# EAGLE design ring_oled_v3-touch (EAGLE 9.6.2)
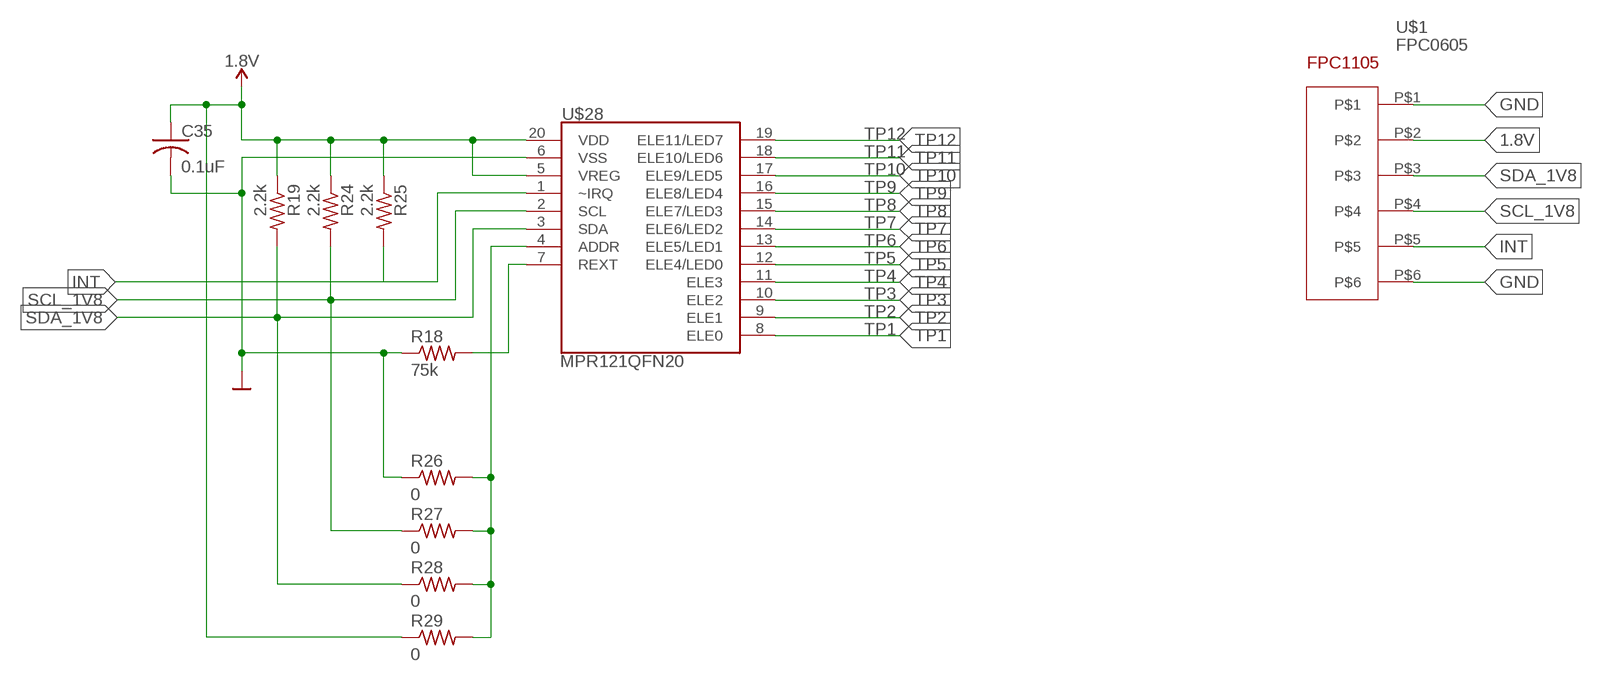
[diagram p0: schematic, sheet 1]

## Parts
C35  0.1uF  C-USC0402  [C0402]
R18  75k  R-US_R0402  [R0402]
R19  2.2k  R-US_R0402  [R0402]
R24  2.2k  R-US_R0402  [R0402]
R25  2.2k  R-US_R0402  [R0402]
R26  0  R-US_R0402  [R0402]
R27  0  R-US_R0402  [R0402]
R28  0  R-US_R0402  [R0402]
R29  0  R-US_R0402  [R0402]
U$1  FPC0605  [FPC0605]
U$28  MPR121QFN20  [QFN-20-0.4MM]

## Nets
1.8V [power]: C35.1 R19.1 R24.1 R25.1 R29.1 U$1.P$2 U$28.5(VREG) U$28.20(VDD)
GND: C35.2 R18.1 R26.1 U$1.P$1 U$1.P$6 U$28.6(VSS)
INT: R25.2 U$1.P$5 U$28.1(~IRQ)
N$15: R18.2 U$28.7(REXT)
N$21: R26.2 R27.2 R28.2 R29.2 U$28.4(ADDR)
SCL_1V8: R24.2 R27.1 U$1.P$4 U$28.2(SCL)
SDA_1V8: R19.2 R28.1 U$1.P$3 U$28.3(SDA)
TP1: U$28.8(ELE0)
TP2: U$28.9(ELE1)
TP3: U$28.10(ELE2)
TP4: U$28.11(ELE3)
TP5: U$28.12(ELE4/LED0)
TP6: U$28.13(ELE5/LED1)
TP7: U$28.14(ELE6/LED2)
TP8: U$28.15(ELE7/LED3)
TP9: U$28.16(ELE8/LED4)
TP10: U$28.17(ELE9/LED5)
TP11: U$28.18(ELE10/LED6)
TP12: U$28.19(ELE11/LED7)

## Library data of the parts
C35 = rcl:C-US: CAPACITOR, American symbol; SPICEPREFIX: C
R18 R19 R24-R29 = rcl:R-US_: RESISTOR, American symbol; SPICEPREFIX: R
U$1 = fpc_card_edge:FPC0605
U$28 = MPR121:MPR121: MPR121 Capacitive Touch Sensor Controller Check availability <https://pricing.snapeda.com/parts/MPR121/Freescale%20Semiconductor%20-%20NXP/view-part?ref=eda>; AVAILABILITY: In Stock; CHECK_PRICES: https://www.snapeda.com/parts/MPR121/NXP+Semiconductors/view-part/?ref=eda; DESCRIPTION: Proximity Capacitive Touch Sensor Controller; MF: Freescale Semiconductor - NXP; MP: MPR121; PACKAGE: None; PRICE: None; SNAPEDA_LINK: https://www.snapeda.com/parts/MPR121/NXP+Semiconductors/view-part/?ref=snap

## Net classes
1 power: width 0.203 mm

## Board
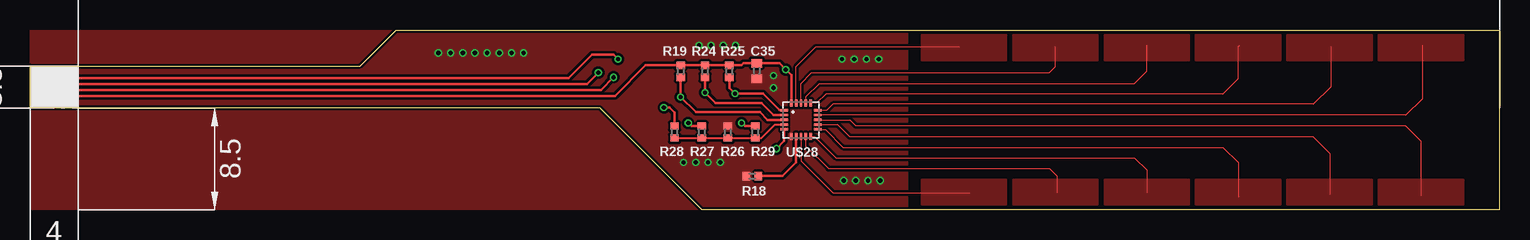
[diagram p1: board, top side]
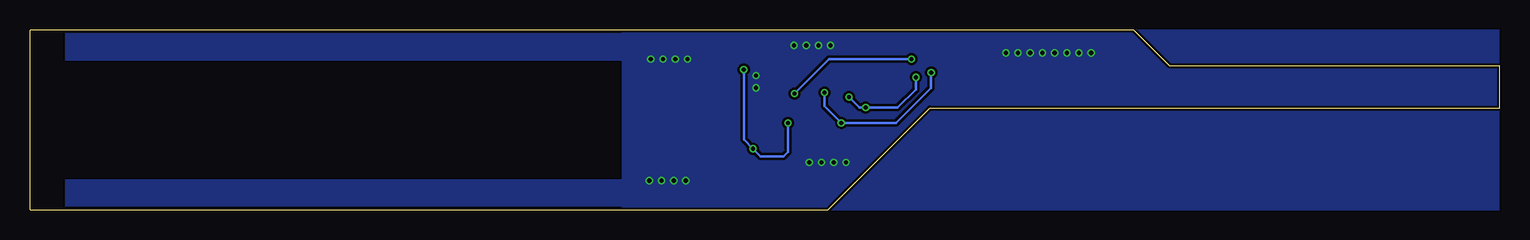
[diagram p2: board, bottom side, seen from below]

Size 122.5 x 15 mm. Coordinates in mm from the lower left corner, seen from the top.
Outline: 122.5,0 122.5,15 30.5,15 27.5,12 0,12 0,8.5 47.5,8.5 56,0 122.5,0
Copper layers (1*16): Top 0.035mm / dielectric 1.6mm / Bottom 0.035mm
Design rules "jlcpcb-2layers *": minimum track width 4mil, minimum drill 0.3mm, track to track 5mil, track to pad 5mil, pad to pad 5mil, via to via 5mil, smd to smd 5mil, copper to edge 0.2mm, drill to drill 6mil, minimum pad ring 10mil, minimum via ring 3mil, stop-mask expansion 4mil, vias tented up to drill 20mil, thermal gap 10mil

### Footprints (pad centres in the part's own frame; a part is rotated, then mirrored left to right if it is on the bottom)
C0402 = smd 0.7 x 0.9: 1 -0.65,0; 2 0.65,0
R0402 = smd 0.6 x 0.7: 1 -0.5,0; 2 0.5,0
FPC0605 = smd 0.3 x 3.5: P$1 1.25,0; P$2 0.75,0; P$3 0.25,0; P$4 -0.25,0; P$5 -0.75,0; P$6 -1.25,0
QFN-20-0.4MM = smd 0.6 x 0.2: 1 -1.4,0.8; 2 -1.4,0.4; 3 -1.4,0; 4 -1.4,-0.4; 5 -1.4,-0.8; 11 1.4,-0.8; 12 1.4,-0.4; 13 1.4,0; 14 1.4,0.4; 15 1.4,0.8 | smd 0.2 x 0.6: 6 -0.8,-1.4; 7 -0.4,-1.4; 8 0,-1.4; 9 0.4,-1.4; 10 0.8,-1.4; 16 0.8,1.4; 17 0.4,1.4; 18 0,1.4; 19 -0.4,1.4; 20 -0.8,1.4

### Placement (x,y rotation side)
C35  60.59,11.57 270 top
R18  60.21,2.79 0 top
R19  54.24,11.55 270 top
R24  56.27,11.55 270 top
R25  58.3,11.55 270 top
R26  58.17,6.47 270 top
R27  56.01,6.47 270 top
R28  53.73,6.47 270 top
R29  60.46,6.47 270 top
U$1  1.75,10.25 270 top
U$28  64.27,7.49 0 top

### Tracks (layer width: path | path; a pad name or v marks a point on that pad's centre or on a via)
1.8V  (via drill 0.35 pad 0.6)
  Top 0.203: U$28.20 63.47,11.21 v63,11.68 62.46,12.22 C35.1 59.49,12.22 59.32,12.05 R25.1 R24.1 R19.1 54.22,12.06 51.31,12.06 48.75,9.5 U$1.P$2 | U$28.5 62.87,5.71 v62.24,5.08 | R29.1 59.59,6.97 v59.32,7.24
  Bottom 0.203: v63,11.68 63,5.84 v62.24,5.08 61.6,4.45 59.7,4.45 59.32,4.83 v59.32,7.24
GND  (via drill 0.35 pad 0.6)
  other vias: 34.04,13.08 35.06,13.08 36.08,13.08 37.09,13.08 55.76,13.72 56.78,13.72 57.79,13.72 58.81,13.72 54.49,3.94 55.51,3.94 56.52,3.94 57.54,3.94 38.11,13.08 39.12,13.08 40.14,13.08 41.16,13.08 61.98,11.18 61.98,10.16 67.7,12.57 68.71,12.57 69.73,12.57 70.75,12.57 67.83,2.41 68.84,2.41 69.86,2.41 70.87,2.41
  pour Top (isolate 0.203, no thermals): 73.16,0 0.01,0 0.01,14.99 73.16,14.99
  pour Bottom (isolate 0.203, no thermals): 73.16,0 0.01,0 0.01,14.99 73.16,14.99
  pour Bottom (no thermals): 73.16,14.73 73.16,12.45 119.51,12.45 119.51,14.61 119.51,14.73
  pour Bottom (no thermals): 73.16,2.54 73.16,0.25 119.51,0.25 119.51,2.41 119.51,2.54
INT  (via drill 0.35 pad 0.6)
  Top 0.203: U$1.P$5 44.92,11 46.87,12.95 48.65,12.95 v49.03,12.57 | R25.2 58.3,10.16 v58.77,9.69 61.09,9.69 62.49,8.29 U$28.1
  Bottom 0.203: v49.03,12.57 55.89,12.57 v58.77,9.69
N$15
  Top 0.203: R18.2 62.74,2.79 63.87,3.92 U$28.7
N$21
  Top 0.178: R28.2 R27.2 R26.2 R29.2 60.97,5.97 62.09,7.09 U$28.4
SCL_1V8  (via drill 0.35 pad 0.6)
  Top 0.203: R24.2 v56.27,9.78 57.16,8.89 60.97,8.89 61.96,7.89 U$28.2 | R27.1 55.14,6.97 v54.87,7.24 | U$1.P$4 46.45,10.5 v47.38,11.43
  Bottom 0.203: v56.27,9.78 56.27,8.64 v54.87,7.24 50.3,7.24 47.38,10.16 v47.38,11.43
SDA_1V8  (via drill 0.35 pad 0.6)
  Top 0.203: R19.2 v54.24,9.4 55.51,8.13 60.84,8.13 61.48,7.49 U$28.3 | R28.1 53.73,8.11 53.33,8.51 v52.84,8.51 | U$1.P$3 47.6,10 v48.65,11.05
  Bottom 0.203: v54.24,9.4 53.35,8.51 v52.84,8.51 50.17,8.51 48.65,10.03 v48.65,11.05
TP1
  Top 0.102: U$28.8 64.27,4.06 66.94,1.4 78.37,1.4
  pour Top (rank 2, no thermals): 74.3,2.54 81.41,2.54 81.41,0.38 74.3,0.38
TP2
  Top 0.102: U$28.9 64.65,6.08 64.65,5.33 66.56,3.43 84.97,3.43 85.61,2.79 85.61,1.4
  pour Top (rank 2, no thermals): 81.92,2.54 89.03,2.54 89.03,0.38 81.92,0.38
TP3
  Top 0.102: U$28.10 65.41,6.09 67.19,4.32 92.08,4.32 93.1,3.3 93.1,1.4
  pour Top (rank 2, no thermals): 89.54,2.54 96.65,2.54 96.65,0.38 89.54,0.38
TP4
  Top 0.102: U$28.11 66.3,6.69 67.79,5.21 99.45,5.21 100.72,3.94 100.72,1.02
  pour Top (rank 2, no thermals): 97.16,2.54 104.27,2.54 104.27,0.38 97.16,0.38
TP5
  Top 0.102: U$28.12 67.32,7.09 68.34,6.08 106.96,6.08 108.34,4.7 108.34,1.27
  pour Top (rank 2, no thermals): 104.78,2.54 111.89,2.54 111.89,0.38 104.78,0.38
TP6
  Top 0.102: U$28.13 68.34,7.49 68.84,6.99 114.69,6.99 115.96,5.71 115.96,1.14
  pour Top (rank 2, no thermals): 112.4,2.54 119.51,2.54 119.51,0.38 112.4,0.38
TP7
  Top 0.102: U$28.14 114.71,7.89 116.08,9.27 116.08,13.72
  pour Top (rank 2, no thermals): 112.4,14.61 119.51,14.61 119.51,12.45 112.4,12.45
TP8
  Top 0.102: U$28.15 66.43,8.29 66.94,8.8 106.98,8.8 108.47,10.29 108.47,13.59
  pour Top (rank 2, no thermals): 104.78,14.61 111.89,14.61 111.89,12.45 104.78,12.45
TP9
  Top 0.102: U$28.16 65.58,8.89 66.34,9.65 99.45,9.65 100.72,10.92 100.72,13.59 100.84,13.72
  pour Top (rank 2, no thermals): 97.16,14.61 104.27,14.61 104.27,12.45 97.16,12.45
TP10
  Top 0.102: U$28.17 64.67,9.42 65.79,10.54 92.08,10.54 93.1,11.56 93.1,13.72
  pour Top (rank 2, no thermals): 89.54,14.61 96.65,14.61 96.65,12.45 89.54,12.45
TP11
  Top 0.102: U$28.18 64.27,10.54 65.16,11.43 84.97,11.43 85.48,11.94 85.48,13.59
  pour Top (rank 2, no thermals): 81.92,14.61 89.03,14.61 89.03,12.45 81.92,12.45
TP12
  Top 0.102: U$28.19 63.87,11.92 65.54,13.59 77.48,13.59
  pour Top (rank 2, no thermals): 74.3,14.61 81.41,14.61 81.41,12.45 74.3,12.45

### Text on the board
tPlace: Stiffener PI 0.1mm